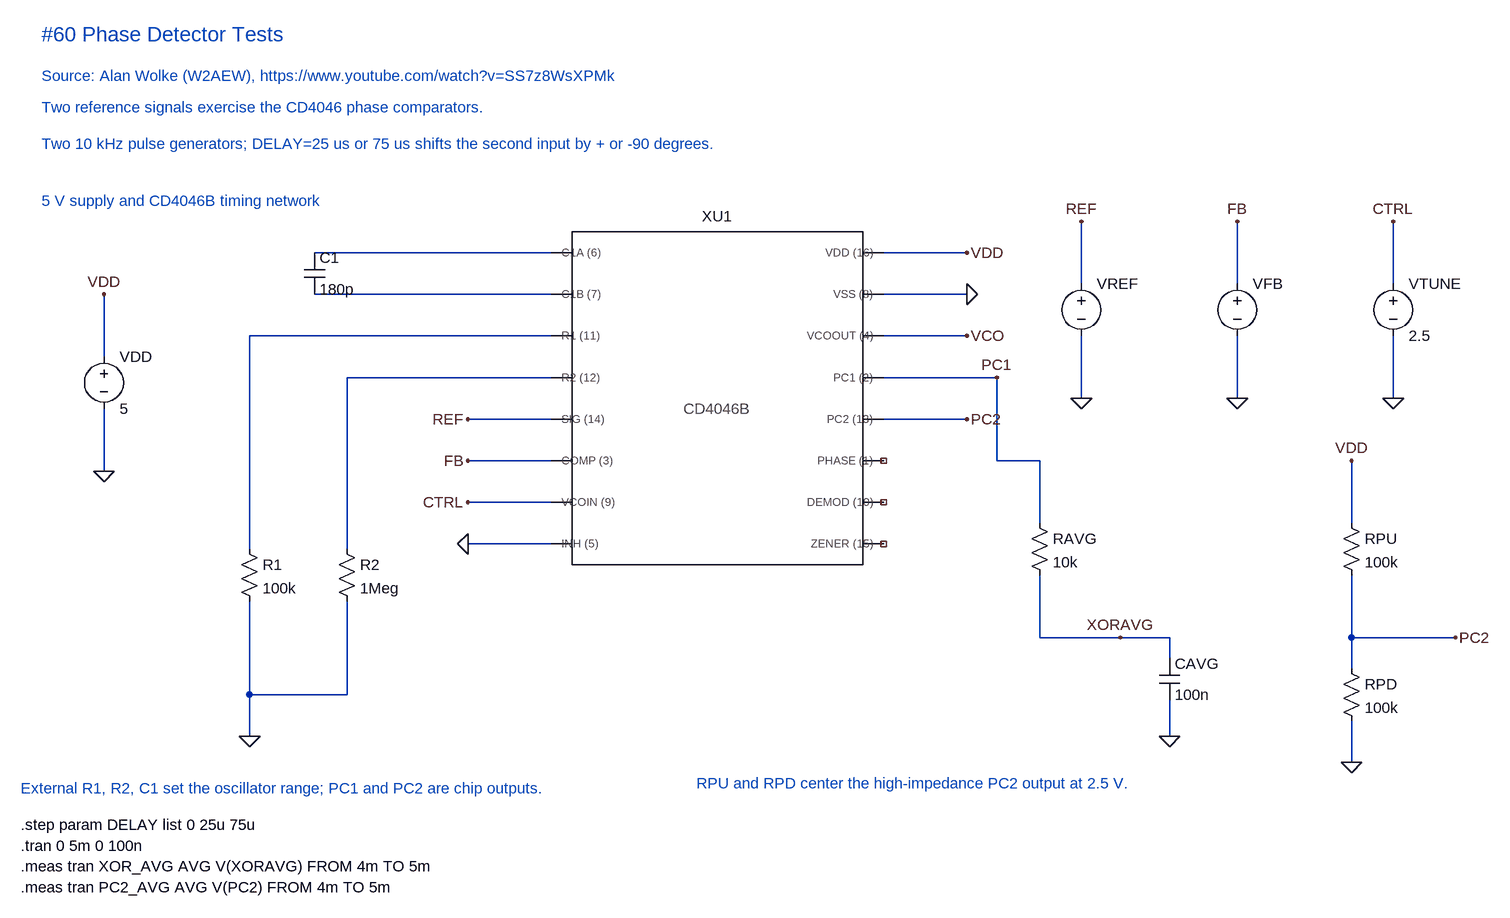
[diagram p0: schematic Phase Detector Tests.asc]
Phase Detector Tests.asc, the LTspice schematic file:
Version 4.1
SHEET 1 3100 1900
WIRE 864 0 500 0
WIRE 1504 0 1376 0
WIRE 1680 48 1680 -48
WIRE 1920 48 1920 -48
WIRE 2160 48 2160 -48
WIRE 864 64 500 64
WIRE 1504 64 1376 64
WIRE 864 128 400 128
WIRE 1504 128 1376 128
WIRE 176 160 176 64
WIRE 864 192 550 192
WIRE 1550 192 1376 192
WIRE 1680 224 1680 128
WIRE 1920 224 1920 128
WIRE 2160 224 2160 128
WIRE 864 256 736 256
WIRE 1504 256 1376 256
WIRE 864 320 736 320
WIRE 1550 320 1550 192
WIRE 176 336 176 240
WIRE 864 384 736 384
WIRE 864 448 736 448
WIRE 400 456 400 128
WIRE 550 456 550 192
WIRE 400 680 400 536
WIRE 550 680 550 536
WIRE 550 680 400 680
WIRE 400 744 400 680
WIRE 1616 320 1550 320
WIRE 1616 416 1616 320
WIRE 1616 592 1616 496
WIRE 1740 592 1616 592
WIRE 1816 592 1740 592
WIRE 1816 624 1816 592
WIRE 1816 744 1816 688
WIRE 2096 416 2096 320
WIRE 2096 592 2096 496
WIRE 2096 640 2096 592
WIRE 2096 784 2096 720
WIRE 2256 592 2096 592
FLAG 176 64 VDD
FLAG 176 336 0
FLAG 400 744 0
FLAG 736 256 REF
FLAG 736 320 FB
FLAG 736 384 CTRL
FLAG 736 448 0
FLAG 1504 0 VDD
FLAG 1504 64 0
FLAG 1504 128 VCO
FLAG 1504 256 PC2
FLAG 1680 -48 REF
FLAG 1680 224 0
FLAG 1920 -48 FB
FLAG 1920 224 0
FLAG 2160 -48 CTRL
FLAG 2160 224 0
FLAG 1816 744 0
FLAG 2096 320 VDD
FLAG 2096 784 0
FLAG 1550 192 PC1
FLAG 1740 592 XORAVG
FLAG 2256 592 PC2
SYMBOL voltage 176 144 R0
SYMATTR InstName VDD
SYMATTR Value 5
SYMBOL cap 484 0 R0
SYMATTR InstName C1
SYMATTR Value 180p
SYMBOL res 384 440 R0
SYMATTR InstName R1
SYMATTR Value 100k
SYMBOL res 534 440 R0
SYMATTR InstName R2
SYMATTR Value 1Meg
SYMBOL ..\..\LTspice\Symbols\CD4046_board 1120 0 R0
SYMATTR InstName XU1
SYMBOL voltage 1680 32 R0
WINDOW 3 24 96 Invisible 2
SYMATTR Value PULSE(0 5 0 20n 20n 50u 100u)
SYMATTR InstName VREF
SYMBOL voltage 1920 32 R0
WINDOW 3 24 96 Invisible 2
SYMATTR Value PULSE(0 5 {DELAY} 20n 20n 50u 100u)
SYMATTR InstName VFB
SYMBOL voltage 2160 32 R0
SYMATTR InstName VTUNE
SYMATTR Value 2.5
SYMBOL res 1600 400 R0
SYMATTR InstName RAVG
SYMATTR Value 10k
SYMBOL cap 1800 624 R0
SYMATTR InstName CAVG
SYMATTR Value 100n
SYMBOL res 2080 400 R0
SYMATTR InstName RPU
SYMATTR Value 100k
SYMBOL res 2080 624 R0
SYMATTR InstName RPD
SYMATTR Value 100k
TEXT 80 -168 Left 2 ;Two 10 kHz pulse generators; DELAY=25 us or 75 us shifts the second input by + or -90 degrees.
TEXT 80 -80 Left 2 ;5 V supply and CD4046B timing network
TEXT 48 824 Left 2 ;External R1, R2, C1 set the oscillator range; PC1 and PC2 are chip outputs.
TEXT 1088 816 Left 2 ;RPU and RPD center the high-impedance PC2 output at 2.5 V.
TEXT 48 880 Left 2 !.step param DELAY list 0 25u 75u
TEXT 48 912 Left 2 !.tran 0 5m 0 100n
TEXT 48 944 Left 2 !.meas tran XOR_AVG AVG V(XORAVG) FROM 4m TO 5m
TEXT 48 976 Left 2 !.meas tran PC2_AVG AVG V(PC2) FROM 4m TO 5m
TEXT 80 -336 Left 3 ;#60 Phase Detector Tests
TEXT 80 -272 Left 2 ;Source: Alan Wolke (W2AEW), https://www.youtube.com/watch?v=SS7z8WsXPMk
TEXT 80 -224 Left 2 ;Two reference signals exercise the CD4046 phase comparators.

The netlist it stands for:
* Phase Detector Tests.asc
VDD VDD 0 5
C1 N001 N002 180p
R1 N003 0 100k
R2 N004 0 1Meg
X§XU1 N001 N002 FB 0 N003 N004 REF CTRL VDD 0 NC_01 PC1 PC2 NC_02 VCO NC_03 CD4046Bg  ; pins C1A_(6) C1B_(7) COMP_(3) INH_(5) R1_(11) R2_(12) SIG_(14) VCOIN_(9) VDD_(16) VSS_(8) DEMOD_(10) PC1_(2) PC2_(13) PHASE_(1) VCOOUT_(4) ZENER_(15)
VREF REF 0 PULSE(0 5 0 20n 20n 50u 100u)
VFB FB 0 PULSE(0 5 {DELAY} 20n 20n 50u 100u)
VTUNE CTRL 0 2.5
RAVG PC1 XORAVG 10k
CAVG XORAVG 0 100n
RPU VDD PC2 100k
RPD PC2 0 100k
* Two 10 kHz pulse generators; DELAY=25 us or 75 us shifts the second input by + or -90 degrees.
* 5 V supply and CD4046B timing network
* External R1, R2, C1 set the oscillator range; PC1 and PC2 are chip outputs.
* RPU and RPD center the high-impedance PC2 output at 2.5 V.
.step param DELAY list 0 25u 75u
.tran 0 5m 0 100n
.meas tran XOR_AVG AVG V(XORAVG) FROM 4m TO 5m
.meas tran PC2_AVG AVG V(PC2) FROM 4m TO 5m
* #60 Phase Detector Tests
* Source: Alan Wolke (W2AEW), https://www.youtube.com/watch?v=SS7z8WsXPMk
* Two reference signals exercise the CD4046 phase comparators.
.lib ..\..\LTspice\Models\Community\CD4046Bg-corrected.sub
.backanno
.end